# Altium schematic sheet Battery_Logic.SchDoc
size A; SheetNumber: 1; SheetTotal: 4
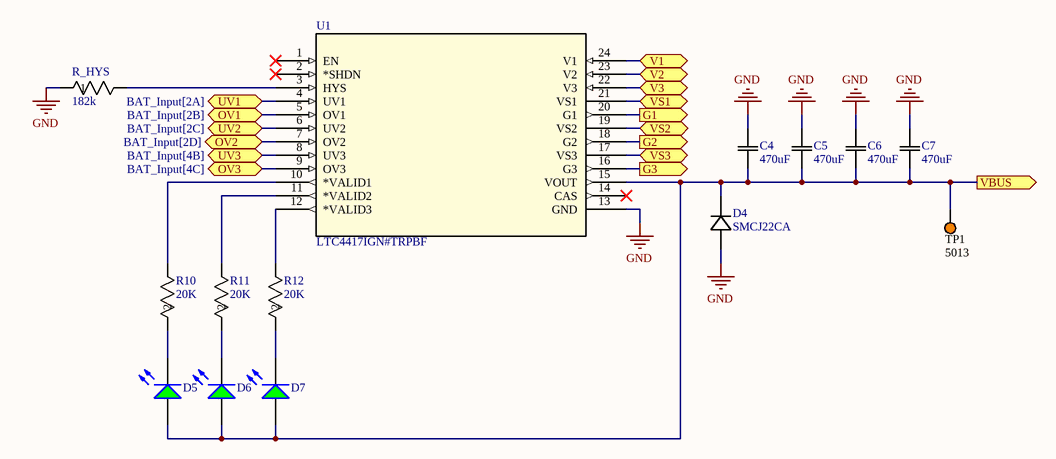
[diagram p0: Battery_Logic.SchDoc]

## Parts
C4  470uF  [CAP_EEHZ-G16_PAN]
C5  470uF  [CAP_EEHZ-G16_PAN]
C6  470uF  [CAP_EEHZ-G16_PAN]
C7  470uF  [CAP_EEHZ-G16_PAN]
D4  SMCJ22CA  [SMCJSeries_LTF]
D5  597-3311-407F  [DIAL-597-3311-407F_V]  (value not drawn)
D6  597-3311-407F  [DIAL-597-3311-407F_V]  (value not drawn)
D7  597-3311-407F  [DIAL-597-3311-407F_V]  (value not drawn)
R10  20K  [RC0603N_PAN]
R11  20K  [RC0603N_PAN]
R12  20K  [RC0603N_PAN]
R_HYS  182k  [RES_RMCF0603_STP]
TP1  5013  [KSTN-5013_V]
U1  LTC4417IGN#TRPBF  [SSOP-24_GN_LIT]

## Ports
G1 (out, see FET_PowerPath[3A], FET_PowerPath[4A]), G2 (out, see FET_PowerPath[3C], FET_PowerPath[4C]), G3 (out, see FET_PowerPath[3D], FET_PowerPath[4D]), OV1 (bidir, see BAT_Input[2B]), OV2 (bidir, see BAT_Input[2D]), OV3 (bidir, see BAT_Input[4C]), UV1 (bidir, see BAT_Input[2A]), UV2 (bidir, see BAT_Input[2C]), UV3 (bidir, see BAT_Input[4B]), V1 (bidir, see BAT_Input[2A], FET_PowerPath[2A]), V2 (bidir, see BAT_Input[2C], FET_PowerPath[2B]), V3 (bidir, see BAT_Input[4B], FET_PowerPath[2C]), VBUS (out, see Buck_Converter[1C], FET_PowerPath[5A], FET_PowerPath[5B], FET_PowerPath[5C]), VS1 (bidir, see FET_PowerPath[4B]), VS2 (bidir, see FET_PowerPath[4C]), VS3 (bidir, see FET_PowerPath[4D])

## Nets
GND: C4.2 C5.2 C6.2 C7.2 D4.2 R_HYS.1 U1.13(GND)
G1: U1.20(G1) ; port G1
G2: U1.18(G2) ; port G2
G3: U1.16(G3) ; port G3
OV1: U1.5(OV1) ; port OV1
OV2: U1.7(OV2) ; port OV2
OV3: U1.9(OV3) ; port OV3
UV1: U1.4(UV1) ; port UV1
UV2: U1.6(UV2) ; port UV2
UV3: U1.8(UV3) ; port UV3
V1: U1.24(V1) ; port V1
V2: U1.23(V2) ; port V2
V3: U1.22(V3) ; port V3
VBUS: C4.1 C5.1 C6.1 C7.1 D4.1 D5.1(A) D6.1(A) D7.1(A) TP1.1 U1.15(VOUT) ; port VBUS
VS1: U1.21(VS1) ; port VS1
VS2: U1.19(VS2) ; port VS2
VS3: U1.17(VS3) ; port VS3
NetD5_2: D5.2(K) R10.2
NetD6_2: D6.2(K) R11.2
NetD7_2: D7.2(K) R12.2
NetR10_1: R10.1 U1.10(*VALID1)
NetR11_1: R11.1 U1.11(*VALID2)
NetR12_1: R12.1 U1.12(*VALID3)
NetR_HYS_2: R_HYS.2 U1.3(HYS)

Not connected (* = marked no-connect by the designer): U1 1(EN)* 2(*SHDN)* 14(CAS)*

## Library data of the parts
C4-C7 = EEHZU1V471V: Description; Manufacturer_Name: Panasonic; Copyright: Copyright (C) 2025 Ultra Librarian. All rights reserved.; Manufacturer_Part_Number: EEHZU1V471V
D4 = SMCJ22CA: No Description Available; Manufacturer_Name: Littelfuse Inc; Copyright: Copyright (C) 2026 Ultra Librarian. All rights reserved.; Manufacturer_Part_Number: SMCJ22CA
D5-D7 = CMP-2000-05651-1: LED Green, 75 mW, 30 mA, -30 to 85 degC, 2-Pin SMD, RoHS, Tape and Reel; Manufacturer: Dialight; Product Depth (mm): 1.5mm; Viewing Angle: 70deg; DELETED: Compliant; Number of  Elements: 1; Emitting Color: YellowGreen; Shape Type: Rectangular; Product Length (mm): 3mm; Forward Current: 30mA; Main Category: ChipLED; Luminous Intensity: 7.5mcd; Type: Uni-Color; High Brightness: No; Test Current (It): 20mA; Lens Type: NonDiffused; Reverse Voltage: 4V; Peak Wavelength: 560nm; Power Dissipation: 75W; Forward Voltage: 2.5V; Chip Material: GaP; Mounting: SurfaceMount; Product Height (mm): 1.5mm; Pin Count: 2; Datasheet URL: https://datasheet.ciiva.com/15117/getdatasheetpartid-142484-15117764.pdf; Mounting Technology: SurfaceMount; Rad Hardened: No; Operating Temperature Classification: Commercial; Lens Dimensions: 2x1.5x0.9mm; Operating Temp Range: -30Cto85C; Package Reference: 597-3311-407F; Package Type: SMD; Datasheet Version: 07/2002; Lum Intensity: 7.5mcd; Packaging: TapeandReel; Package Description: 2-Pin Surface Mount Device, Body 1.5 x 3 mm; Manufacturer URL: http://www.dialight.com/
R10-R12 = ERJ-3EKF2002V: Description; Manufacturer_Name: Panasonic; Copyright: Copyright (C) 2025 Ultra Librarian. All rights reserved.; Manufacturer_Part_Number: ERJ-3EKF2002V
R_HYS = RMCF0603FT182K: No Description Available; Manufacturer_Name: Stackpole International; Copyright: Copyright (C) 2026 Ultra Librarian. All rights reserved.; Manufacturer_Part_Number: RMCF0603FT182K
TP1 = CMP-1672-00005-4: Test Point, Orange, Through Hole, RoHS, Bulk; Manufacturer: Keystone; REACH SVHC: No SVHC; ComponentLink2Description: Datasheet; PackageDescription: 1-Pin Through Hole Device, Dia 3.17 mm; Package Quantity: 100; PackageReference: 5013; Contact Material: Bronze; DatasheetVersion: Rev. F, 12/2013; ComponentLink2URL: http://www.keyelco.com/product-pdf.cfm?p=1322; Contact Plating: Silver; ComponentLink1URL: http://www.keyelco.com/; Packaging: Bulk; ComponentLink1Description: Manufacturer URL; Colour: Orange; Height: 8.12 mm; RoHSCompliant: True; Mount: Through Hole; Mounting Technology: Through Hole
U1 = LTC4417IGNTRPBF: Prioritized PowerPathâ„¢ Controller; Manufacturer_Name: Analog Devices Inc; Copyright: Copyright (C) 2025 Ultra Librarian. All rights reserved.; Manufacturer_Part_Number: LTC4417IGN#TRPBF; RefDes: RefDes; Type: Type